# Altium schematic sheet iR-Blaster_Section.SchDoc: =Projectname
size A4; SheetNumber: 2; SheetTotal: 4
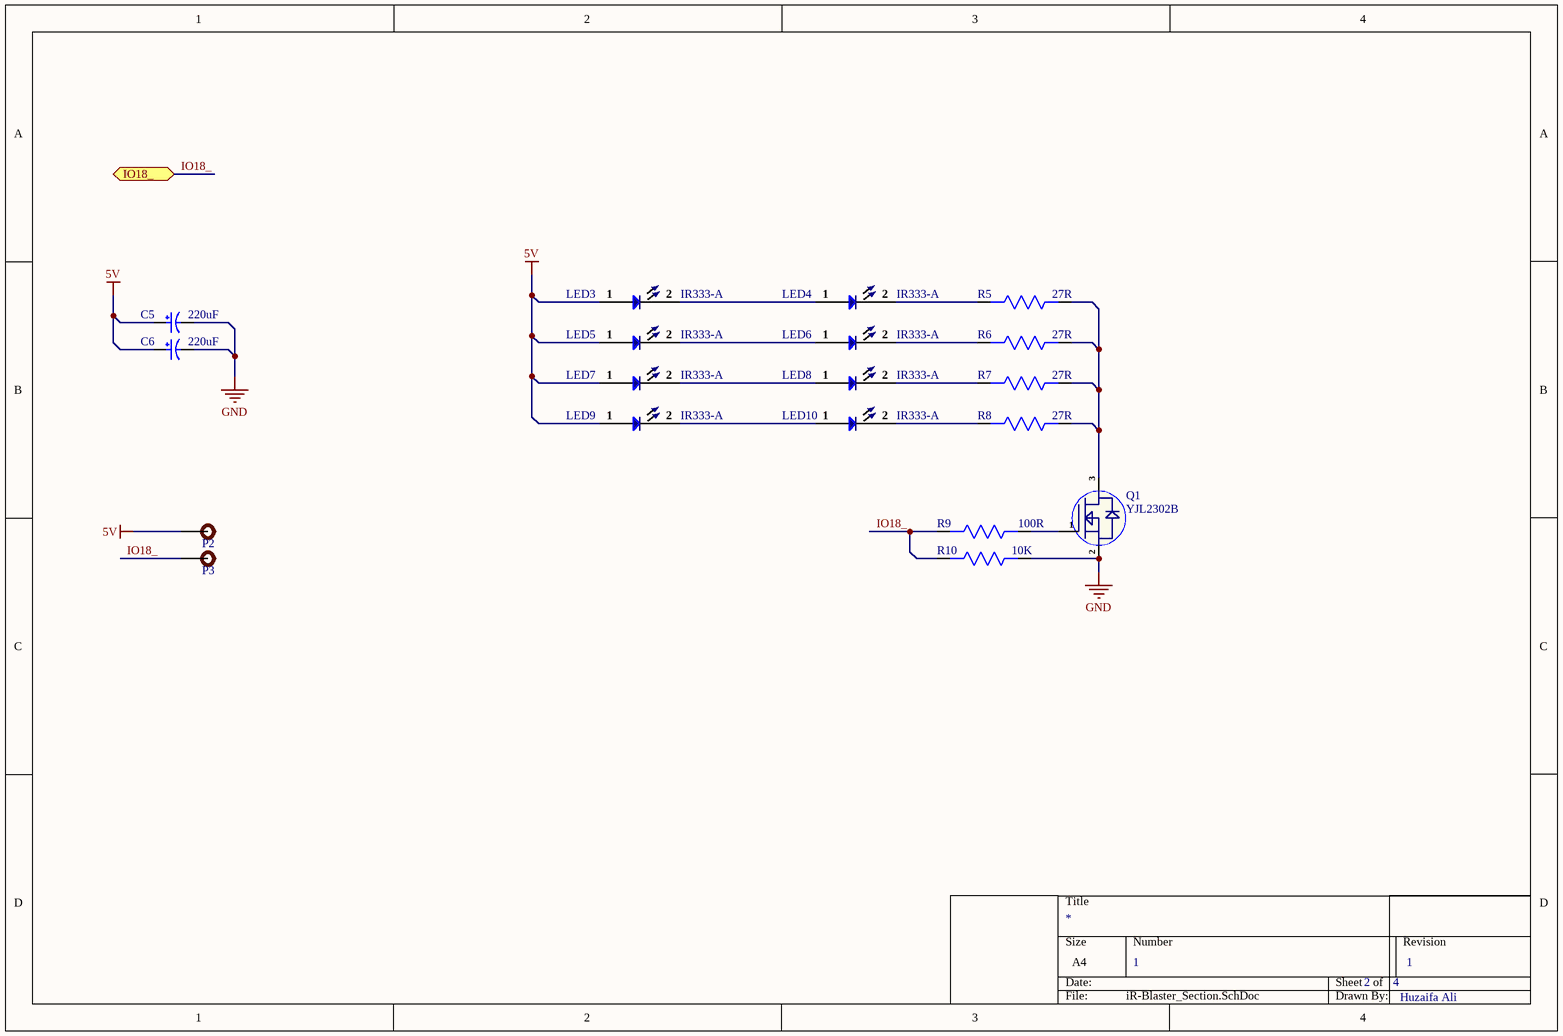
[diagram p0: iR-Blaster_Section.SchDoc]

## Parts
C5  220uF  [RT1A221M0605]
C6  220uF  [RT1A221M0605]
LED3  IR333-A  [IR333_A]
LED4  IR333-A  [IR333_A]
LED5  IR333-A  [IR333_A]
LED6  IR333-A  [IR333_A]
LED7  IR333-A  [IR333_A]
LED8  IR333-A  [IR333_A]
LED9  IR333-A  [IR333_A]
LED10  IR333-A  [IR333_A]
P2  TEST POINT  [Test-point]  (value not drawn)
P3  TEST POINT  [Test-point]  (value not drawn)
Q1  YJL2302B  [SOT-23-3L_]
R5  27R  [Res_1210]
R6  27R  [Res_1210]
R7  27R  [Res_1210]
R8  27R  [Res_1210]
R9  100R  [Res-0603]
R10  10K  [RES-0603]

## Ports
IO18_ (bidir)

## Nets
5V: C5.1 C6.1 LED3.1 LED5.1 LED7.1 LED9.1 P2.1
GND: C5.2 C6.2 Q1.2(S) R10.1
IO18_: P3.1 R9.2 R10.2 ; port IO18_
NetLED3_2: LED3.2 LED4.1
NetLED4_2: LED4.2 R5.2
NetLED5_2: LED5.2 LED6.1
NetLED6_2: LED6.2 R6.2
NetLED7_2: LED7.2 LED8.1
NetLED8_2: LED8.2 R7.2
NetLED9_2: LED9.2 LED10.1
NetLED10_2: LED10.2 R8.2
NetQ1_1: Q1.1(G) R9.1
NetQ1_3: Q1.3(D) R5.1 R6.1 R7.1 R8.1

## Notes on the sheet
- 1
- Huzaifa Ali

## Library data of the parts
C5 C6 = RT1A221M0605: 220uF 5.4mm 10V 6.3mm ±20% SMD,D6.3xL5.4mm Aluminum Electrolytic Capacitors - SMD ROHS; Manufacturer: ROQANG; Manufacturer Part Number: RT1A221M0605; Package: SMD,D6.3xL5.4mm; LCSC Part Number: C267466; Item Type: Capacitor; ComponentLink1Description: LCSC; ComponentLink1URL: https://lcsc.com/product-detail/Aluminum-Electrolytic-Capacitors-SMD_ROQANG-RT1A221M0605_C267466.html
LED3-LED10 = IR333-A: EMITTER IR 940NM 100MA RADIAL; Manufacturer: Everlight; Forward Current: 50mA; Forward Voltage: 1.2V; Viewing Angle: 20°; Lens Style: Diffused,Colored,Circular; Number of LEDs: 1; Test Current: 20mA; Power Dissipation: 100mW; Reverse Voltage: 5V; Item Type: Infrared LED; Supplier 1: Digi-Key; Manufacturer Part Number: IR333-A; RoHS: Yes; Category: LEDs; Stock 1: 73854; Pricing 1: 1=0.54000, 10=0.33000, 100=0.18950, 1000=0.14832, 2000=0.13596, 5000=0.12360, 10000=0.11536, 25000=0.11124 (USD); Mount: Through Hole; Case/Package: Radial; Number of Pins: 2; Min Operating Temperature: -40°C; Max Operating Temperature: 85°C; Packaging: Bulk; Wavelength: 940nm; Package Quantity: 500; Number of Elements: 1; Orientation: Top View; Series: -; Max Power Dissipation: 100mW; Length: 5.9mm; Depth: 5.9mm; RoHS Compliant: Yes; Lead Free: Lead Free; ComponentLink1URL: https://datasheet.ciiva.com/2107/201407061516067600-2107736.pdf?src-supplier=Digi-Key; ComponentLink1Description: https://datasheet.ciiva.com/2107/201407061516067600-2107736.pdf?src-supplier=Digi-Key; ComponentLink2URL: https://datasheet.ciiva.com/48438/ir333-a-eng-tds-48438869.pdf?src-supplier=Distrelec; ComponentLink2Description: https://datasheet.ciiva.com/48438/ir333-a-eng-tds-48438869.pdf?src-supplier=Distrelec; Supplier Part Number 1: 1080-1080-ND; LCSC Part Number: C95407
P2 P3 = TEST POINT: Test Point ON
Q1 = YJL2302B: 20V 3A 40mΩ@4.5V,3A 700mW 780mV@250uA 29pF@10V N Channel 280pF@10V 2.9nC@4.5V -55℃~+150℃@(Tj) SOT-23-3L MOSFETs ROHS; Manufacturer: Yangzhou Yangjie Elec Tech; Item Type: Mosfet; Manufacturer Part Number: YJL2302B; Package: SOT-23-3L; LCSC Part Number: C699316; ComponentLink1Description: LCSC; ComponentLink1URL: https://lcsc.com/product-detail/MOSFETs_Yangzhou-Yangjie-Elec-Tech-YJL2302B_C699316.html
R5-R8 = FRC1210F27R0TS: 500mW Thick Film Resistors 200V ±100ppm/℃ 27Ω 1210 Chip Resistor - SMD ROHS; Manufacturer: FOJAN; Manufacturer Part Number: FRC1210F27R0TS; Package: 1210; LCSC Part Number: C2960734; Item Type: Resistor; ComponentLink1Description: LCSC; ComponentLink1URL: https://www.lcsc.com/product-detail/Chip-span-style-background-color-ff0-Resistor-span-Surface-Mount_FOJAN-FRC1210F27R0TS_C2960734.html
R9 = RC0603FR-07100RL: RES SMD 100 OHM 1% 1/10W 0603; Manufacturer: Yageo; Temperature Coefficient: 100ppm/°C; Voltage Rating (DC): 50V; Power Rating: 100mW; Supplier 1: Arrow Electronics; Manufacturer Part Number: RC0603FR-07100RL; RoHS: Yes; Category: Chip SMD Resistors; Stock 1: 3800000; Pricing 1: 5000=0.00300, 5000=0.00200, 5000=0.00450, 50000=0.00410, 500000=0.00230, 2500000=0.00140 (USD); Case/Package: 0603; Number of Pins: 2; Case Code (Imperial): 0603; Case Code (Metric): 1608; Size Code: 0603; Min Operating Temperature: -55°C; Max Operating Temperature: 155°C; Resistance: 100R; Tolerance: 1%; Resistor Type: Thick Film; Packaging: Tape and Reel; Voltage Rating: 50V; Termination: SMD/SMT; Features: Moisture Resistant; Series: RC; Max Power Dissipation: 100mW; Number of Terminations: 2; Construction: Rectangular; Resistance Tolerance: 1%; Technology: THICK FILM; Length: 1.6mm; Width: 0.8mm; Height: 0.45mm; Depth: 0.8mm; REACH SVHC: Unknown; Lead Free: Lead Free; RoHS Compliant: Yes; Military Standard: Not; Supplier Part Number 1: RC0603FR-07100RL; LCSC Part Number: C105588
R10 = CRGH0603J10K: RES SMD 10K OHM 5% 1/5W 0603; Manufacturer: TE Connectivity Holsworthy; Resistance: 10kR; Temperature Coefficient: 100ppm/°C; Power Rating: 200mW; Voltage Rating: 50V; Number of Resistors: 1; ComponentLink1URL: http://www.farnell.com/datasheets/2167052.pdf?src-supplier=Element14; ComponentLink1Description: http://www.farnell.com/datasheets/2167052.pdf?src-supplier=Element14; ComponentLink2URL: https://www.rohm.com/datasheet/ESR01MZPF/esr-e?src-supplier=Digi-Key; ComponentLink2Description: https://www.rohm.com/datasheet/ESR01MZPF/esr-e?src-supplier=Digi-Key; Supplier 1: Digi-Key; Manufacturer Part Number: CRGH0603J10K; Stock 1: 85818; Pricing 1: 1=0.1, 10=0.049, 100=0.02, 1000=0.00899, 2500=0.0078 (USD); Mount: Surface Mount; Case/Package: 0603; Case Code (Imperial): 0603; Case Code (Metric): 1608; Min Operating Temperature: -55°C; Max Operating Temperature: 125°C; Tolerance: 5%; Packaging: Tape and Reel; Resistor Type: Thick Film,Power resistor; Number of Terminations: 2; Series: CRGH; Termination: Solder; Voltage Rating (DC): 50V; Resistance Tolerance: 5%; Technology: THICK FILM; Length: 1.6mm; Width: 0.8mm; Height: 0.45mm; Depth: 0.8mm; RoHS Compliant: Yes; REACH SVHC: No SVHC; ELV: Compliant; ComponentLink3URL: http://www.farnell.com/datasheets/2007183.pdf?src-supplier=Element14; ComponentLink3Description: http://www.farnell.com/datasheets/2007183.pdf?src-supplier=Element14; Supplier Part Number 1: A126394DKR-ND; LCSC Part Number: C2092011